# Altium schematic sheet 电路原理图.SchDoc
size A4
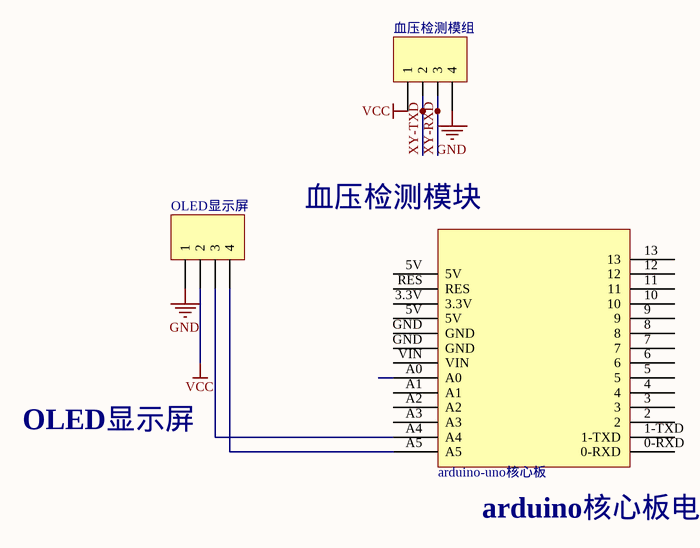
[diagram p0: 电路原理图.SchDoc]

## Parts
arduino-uno核心板  Component_2  (value not drawn)
OLED显示屏  Header 4  [HDR1X4]  (value not drawn)
血压检测模组  Header 4  [HDR1X4]  (value not drawn)

## Nets
GND: OLED显示屏.1 血压检测模组.4
VCC: OLED显示屏.2 血压检测模组.1
XY-RXD: 血压检测模组.3
XY-TXD: 血压检测模组.2
Netarduino-uno核心板_A4: arduino-uno核心板.A4 OLED显示屏.3
Netarduino-uno核心板_A5: arduino-uno核心板.A5 OLED显示屏.4

Not connected (* = marked no-connect by the designer): arduino-uno核心板 0-RXD 1-TXD 2 3 3.3V 4 5 5V 6 7 8 9 10 11 12 13 A0 A1 A2 A3 GND RES VIN

## Notes on the sheet
- 血压检测模块
- OLED显示屏
- (near arduino-uno核心板) arduino核心板电路

## Library data of the parts
OLED显示屏 血压检测模组 = Header 4: Header, 4-Pin; LatestRevisionDate: 17-Jul-2002; LatestRevisionNote: Re-released for DXP Platform.; Publisher: Altium Limited